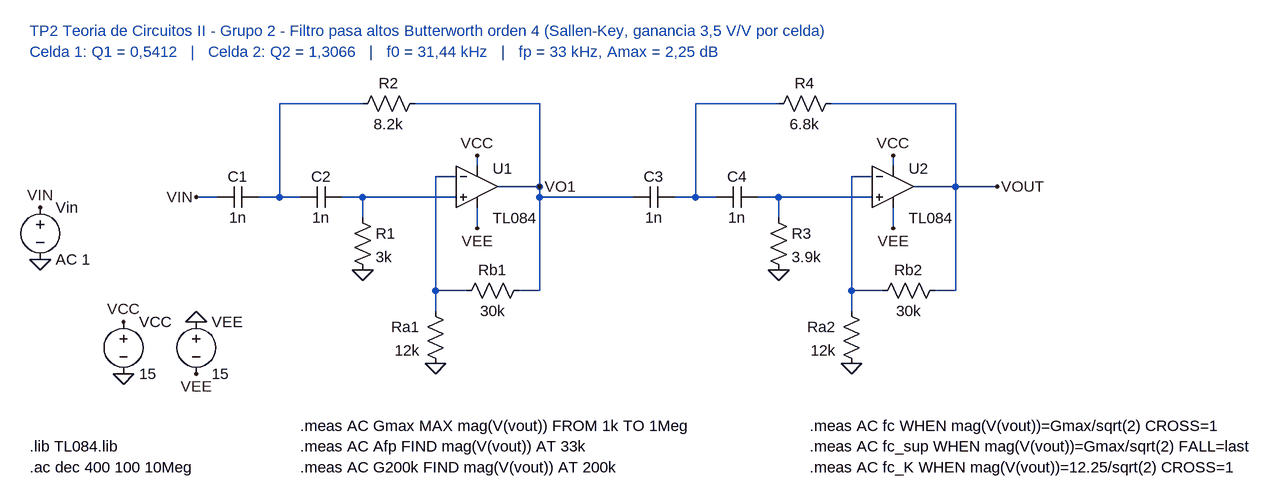
[diagram p0: schematic Filtro_PasaAltos_Orden4_Grupo2.asc]
Filtro_PasaAltos_Orden4_Grupo2.asc, the LTspice schematic file:
Version 4
SHEET 1 1700 640
WIRE 80 144 112 144
WIRE 176 144 208 144
WIRE 208 144 240 144
WIRE 304 144 336 144
WIRE 336 144 480 144
WIRE 336 144 336 176
WIRE 208 144 208 0
WIRE 208 0 336 0
WIRE 416 0 608 0
WIRE 608 0 608 128
WIRE 544 128 608 128
WIRE 480 112 448 112
WIRE 608 128 608 144
WIRE 608 144 752 144
WIRE 816 144 848 144
WIRE 848 144 880 144
WIRE 944 144 976 144
WIRE 976 144 1120 144
WIRE 976 144 976 176
WIRE 848 144 848 0
WIRE 848 0 976 0
WIRE 1056 0 1248 0
WIRE 1248 0 1248 128
WIRE 1184 128 1248 128
WIRE 1120 112 1088 112
WIRE 1248 128 1312 128
FLAG 80 144 VIN
WIRE 448 112 448 288
WIRE 448 288 448 320
WIRE 448 288 496 288
WIRE 576 288 608 288
WIRE 608 288 608 128
WIRE 512 96 512 80
WIRE 512 160 512 192
FLAG 336 256 0
FLAG 448 400 0
FLAG 512 80 VCC
FLAG 512 192 VEE
FLAG 608 128 VO1
FLAG 976 256 0
FLAG 1088 400 0
FLAG 1152 80 VCC
FLAG 1152 192 VEE
FLAG 1312 128 VOUT
WIRE 1088 112 1088 288
WIRE 1088 288 1088 320
WIRE 1088 288 1136 288
WIRE 1216 288 1248 288
WIRE 1248 288 1248 128
WIRE 1152 96 1152 80
WIRE 1152 160 1152 192
FLAG -160 160 VIN
FLAG -160 240 0
FLAG -32 336 VCC
FLAG -32 416 0
FLAG 80 336 0
FLAG 80 416 VEE
SYMBOL cap 176 128 R90
WINDOW 0 0 32 VBottom 2
WINDOW 3 32 32 VTop 2
SYMATTR InstName C1
SYMATTR Value 1n
SYMBOL cap 304 128 R90
WINDOW 0 0 32 VBottom 2
WINDOW 3 32 32 VTop 2
SYMATTR InstName C2
SYMATTR Value 1n
SYMBOL res 320 160 R0
SYMATTR InstName R1
SYMATTR Value 3k
SYMBOL res 432 -16 R90
WINDOW 0 0 56 VBottom 2
WINDOW 3 32 56 VTop 2
SYMATTR InstName R2
SYMATTR Value 8.2k
SYMBOL res 432 304 R0
WINDOW 0 -8 40 Right 2
WINDOW 3 -8 76 Right 2
SYMATTR InstName Ra1
SYMATTR Value 12k
SYMBOL res 592 272 R90
WINDOW 0 0 56 VBottom 2
WINDOW 3 32 56 VTop 2
SYMATTR InstName Rb1
SYMATTR Value 30k
SYMBOL OpAmps\\opamp2 512 64 R0
WINDOW 0 24 36 Left 2
WINDOW 3 24 112 Left 2
SYMATTR InstName U1
SYMATTR Value TL084
SYMBOL cap 816 128 R90
WINDOW 0 0 32 VBottom 2
WINDOW 3 32 32 VTop 2
SYMATTR InstName C3
SYMATTR Value 1n
SYMBOL cap 944 128 R90
WINDOW 0 0 32 VBottom 2
WINDOW 3 32 32 VTop 2
SYMATTR InstName C4
SYMATTR Value 1n
SYMBOL res 960 160 R0
SYMATTR InstName R3
SYMATTR Value 3.9k
SYMBOL res 1072 -16 R90
WINDOW 0 0 56 VBottom 2
WINDOW 3 32 56 VTop 2
SYMATTR InstName R4
SYMATTR Value 6.8k
SYMBOL res 1072 304 R0
WINDOW 0 -8 40 Right 2
WINDOW 3 -8 76 Right 2
SYMATTR InstName Ra2
SYMATTR Value 12k
SYMBOL res 1232 272 R90
WINDOW 0 0 56 VBottom 2
WINDOW 3 32 56 VTop 2
SYMATTR InstName Rb2
SYMATTR Value 30k
SYMBOL OpAmps\\opamp2 1152 64 R0
WINDOW 0 24 36 Left 2
WINDOW 3 24 112 Left 2
SYMATTR InstName U2
SYMATTR Value TL084
SYMBOL voltage -160 144 R0
WINDOW 123 24 124 Left 2
WINDOW 39 0 0 Left 0
SYMATTR InstName Vin
SYMATTR Value AC 1
SYMBOL voltage -32 320 R0
WINDOW 123 0 0 Left 0
WINDOW 39 0 0 Left 0
SYMATTR InstName VCC
SYMATTR Value 15
SYMBOL voltage 80 320 R0
WINDOW 123 0 0 Left 0
WINDOW 39 0 0 Left 0
SYMATTR InstName VEE
SYMATTR Value 15
TEXT -176 -112 Left 2 ;TP2 Teoria de Circuitos II - Grupo 2 - Filtro pasa altos Butterworth orden 4 (Sallen-Key, ganancia 3,5 V/V por celda)
TEXT -176 -80 Left 2 ;Celda 1: Q1 = 0,5412   |   Celda 2: Q2 = 1,3066   |   f0 = 31,44 kHz   |   fp = 33 kHz, Amax = 2,25 dB
TEXT -176 528 Left 2 !.lib TL084.lib
TEXT -176 560 Left 2 !.ac dec 400 100 10Meg
TEXT 240 496 Left 2 !.meas AC Gmax MAX mag(V(vout)) FROM 1k TO 1Meg
TEXT 240 528 Left 2 !.meas AC Afp FIND mag(V(vout)) AT 33k
TEXT 240 560 Left 2 !.meas AC G200k FIND mag(V(vout)) AT 200k
TEXT 1024 496 Left 2 !.meas AC fc WHEN mag(V(vout))=Gmax/sqrt(2) CROSS=1
TEXT 1024 528 Left 2 !.meas AC fc_sup WHEN mag(V(vout))=Gmax/sqrt(2) FALL=last
TEXT 1024 560 Left 2 !.meas AC fc_K WHEN mag(V(vout))=12.25/sqrt(2) CROSS=1

The netlist it stands for:
* Filtro_PasaAltos_Orden4_Grupo2.asc
C1 N001 VIN 1n
C2 N002 N001 1n
R1 N002 0 3k
R2 VO1 N001 8.2k
Ra1 N003 0 12k
Rb1 VO1 N003 30k
XU1 N002 N003 VCC VEE VO1 TL084  ; pins In+ In- V+ V- OUT
C3 N004 VO1 1n
C4 N005 N004 1n
R3 N005 0 3.9k
R4 VOUT N004 6.8k
Ra2 N006 0 12k
Rb2 VOUT N006 30k
XU2 N005 N006 VCC VEE VOUT TL084  ; pins In+ In- V+ V- OUT
Vin VIN 0 AC 1
VCC VCC 0 15
VEE 0 VEE 15
* TP2 Teoria de Circuitos II - Grupo 2 - Filtro pasa altos Butterworth orden 4 (Sallen-Key, ganancia 3,5 V/V por celda)
* Celda 1: Q1 = 0,5412   |   Celda 2: Q2 = 1,3066   |   f0 = 31,44 kHz   |   fp = 33 kHz, Amax = 2,25 dB
.lib TL084.lib
.ac dec 400 100 10Meg
.meas AC Gmax MAX mag(V(vout)) FROM 1k TO 1Meg
.meas AC Afp FIND mag(V(vout)) AT 33k
.meas AC G200k FIND mag(V(vout)) AT 200k
.meas AC fc WHEN mag(V(vout))=Gmax/sqrt(2) CROSS=1
.meas AC fc_sup WHEN mag(V(vout))=Gmax/sqrt(2) FALL=last
.meas AC fc_K WHEN mag(V(vout))=12.25/sqrt(2) CROSS=1
.backanno
.end